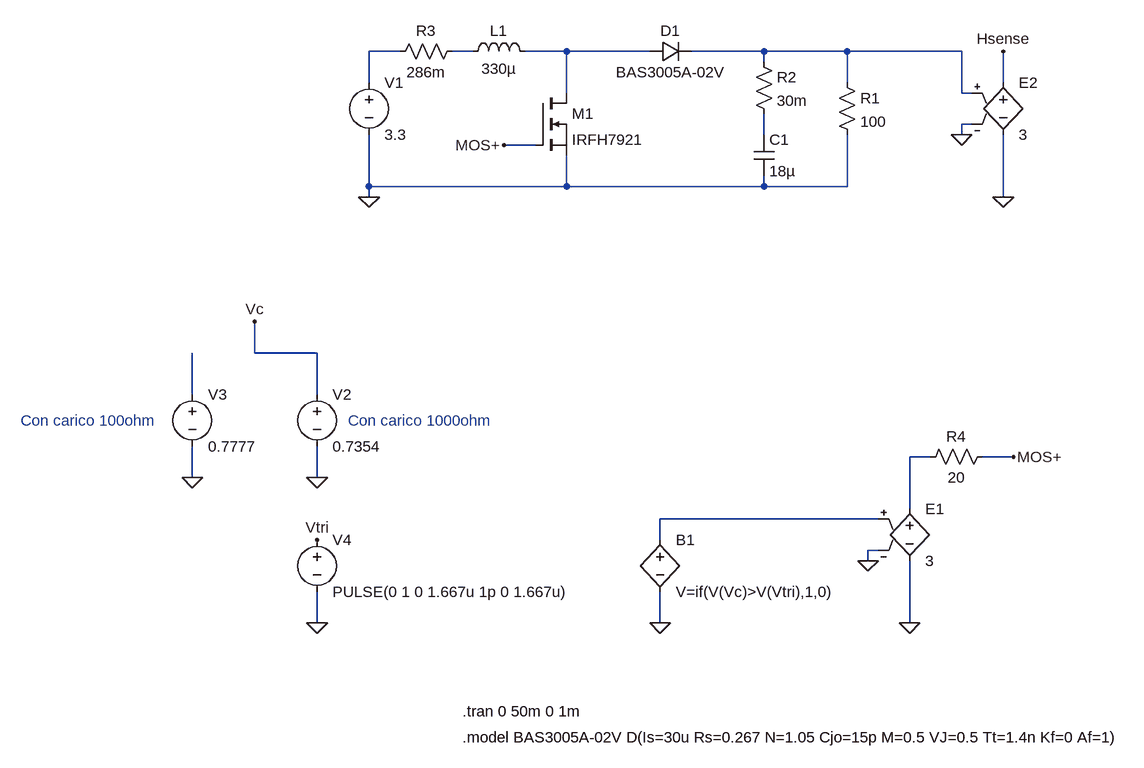
[diagram p0: schematic FDT open loop.asc]
FDT open loop.asc, the LTspice schematic file:
Version 4.1
SHEET 1 1908 680
WIRE -576 -576 -624 -576
WIRE -464 -576 -496 -576
WIRE -320 -576 -384 -576
WIRE -192 -576 -320 -576
WIRE -16 -576 -128 -576
WIRE 112 -576 -16 -576
WIRE 288 -576 112 -576
WIRE -16 -560 -16 -576
WIRE -624 -528 -624 -576
WIRE 112 -528 112 -576
WIRE 352 -528 352 -576
WIRE -320 -512 -320 -576
WIRE 288 -512 288 -576
WIRE 304 -512 288 -512
WIRE 304 -464 288 -464
WIRE -16 -448 -16 -480
WIRE 288 -448 288 -464
WIRE -368 -432 -416 -432
WIRE -624 -368 -624 -448
WIRE -320 -368 -320 -416
WIRE -320 -368 -624 -368
WIRE -16 -368 -16 -384
WIRE -16 -368 -320 -368
WIRE 112 -368 112 -448
WIRE 112 -368 -16 -368
WIRE -624 -352 -624 -368
WIRE 352 -352 352 -448
WIRE -800 -112 -800 -160
WIRE -704 -112 -800 -112
WIRE -896 -48 -896 -112
WIRE -704 -48 -704 -112
WIRE 240 48 208 48
WIRE 368 48 320 48
WIRE -896 80 -896 32
WIRE -704 80 -704 32
WIRE 208 128 208 48
WIRE 160 144 -176 144
WIRE -176 176 -176 144
WIRE 160 192 144 192
WIRE 144 208 144 192
WIRE -704 304 -704 256
WIRE -176 304 -176 256
WIRE 208 304 208 208
FLAG -416 -432 MOS+
FLAG -624 -352 0
FLAG -704 304 0
FLAG -704 176 Vtri
FLAG -704 80 0
FLAG -176 304 0
FLAG 368 48 MOS+
FLAG 208 304 0
FLAG 144 208 0
FLAG 288 -448 0
FLAG 352 -352 0
FLAG 352 -576 Hsense
FLAG -896 80 0
FLAG -800 -160 Vc
SYMBOL voltage -624 -544 R0
WINDOW 123 0 0 Left 0
WINDOW 39 0 0 Left 0
SYMATTR InstName V1
SYMATTR Value 3.3
SYMBOL ind -480 -560 R270
WINDOW 0 32 56 VTop 2
WINDOW 3 5 56 VBottom 2
SYMATTR InstName L1
SYMATTR Value 330µ
SYMBOL diode -192 -560 R270
WINDOW 0 32 32 VTop 2
WINDOW 3 0 32 VBottom 2
SYMATTR InstName D1
SYMATTR Value BAS3005A-02V
SYMBOL cap -32 -448 R0
SYMATTR InstName C1
SYMATTR Value 18µ
SYMBOL res 96 -544 R0
SYMATTR InstName R1
SYMATTR Value 100
SYMBOL nmos -368 -512 R0
SYMATTR InstName M1
SYMATTR Value IRFH7921
SYMBOL voltage -704 160 R0
WINDOW 123 0 0 Left 0
WINDOW 39 0 0 Left 0
SYMATTR InstName V4
SYMATTR Value PULSE(0 1 0 1.667u 1p 0 1.667u)
SYMBOL voltage -704 -64 R0
WINDOW 123 0 0 Left 0
WINDOW 39 0 0 Left 0
SYMATTR InstName V2
SYMATTR Value 0.7354
SYMBOL bv -176 160 R0
SYMATTR InstName B1
SYMATTR Value V=if(V(Vc)>V(Vtri),1,0)
SYMBOL e 208 112 R0
SYMATTR InstName E1
SYMATTR Value 3
SYMBOL res 336 32 R90
WINDOW 0 0 56 VBottom 2
WINDOW 3 32 56 VTop 2
SYMATTR InstName R4
SYMATTR Value 20
SYMBOL e 352 -544 R0
SYMATTR InstName E2
SYMATTR Value 3
SYMBOL res -32 -576 R0
SYMATTR InstName R2
SYMATTR Value 30m
SYMBOL res -480 -592 R90
WINDOW 0 0 56 VBottom 2
WINDOW 3 32 56 VTop 2
SYMATTR InstName R3
SYMATTR Value 286m
SYMBOL voltage -896 -64 R0
WINDOW 123 0 0 Left 0
WINDOW 39 0 0 Left 0
SYMATTR InstName V3
SYMATTR Value 0.7777
TEXT -480 440 Left 2 !.tran 0 50m 0 1m
TEXT -480 480 Left 2 !.model BAS3005A-02V D(Is=30u Rs=0.267 N=1.05 Cjo=15p M=0.5 VJ=0.5 Tt=1.4n Kf=0 Af=1)
TEXT -1160 -8 Left 2 ;Con carico 100ohm
TEXT -656 -8 Left 2 ;Con carico 1000ohm

The netlist it stands for:
* FDT open loop.asc
V1 N001 0 3.3
L1 N002 N003 330µ
D1 N003 N004 BAS3005A-02V
C1 N005 0 18µ
R1 N004 0 100
M1 N003 MOS+ 0 0 IRFH7921
V4 Vtri 0 PULSE(0 1 0 1.667u 1p 0 1.667u)
V2 Vc 0 0.7354
B1 N008 0 V=if(V(Vc)>V(Vtri),1,0)
E1 N007 0 N008 0 3
R4 MOS+ N007 20
E2 Hsense 0 N004 0 3
R2 N004 N005 30m
R3 N002 N001 286m
V3 N006 0 0.7777
.model D D
.lib standard.dio
.model NMOS NMOS
.model PMOS PMOS
.lib standard.mos
.tran 0 50m 0 1m
.model BAS3005A-02V D(Is=30u Rs=0.267 N=1.05 Cjo=15p M=0.5 VJ=0.5 Tt=1.4n Kf=0 Af=1)
* Con carico 100ohm
* Con carico 1000ohm
.backanno
.end